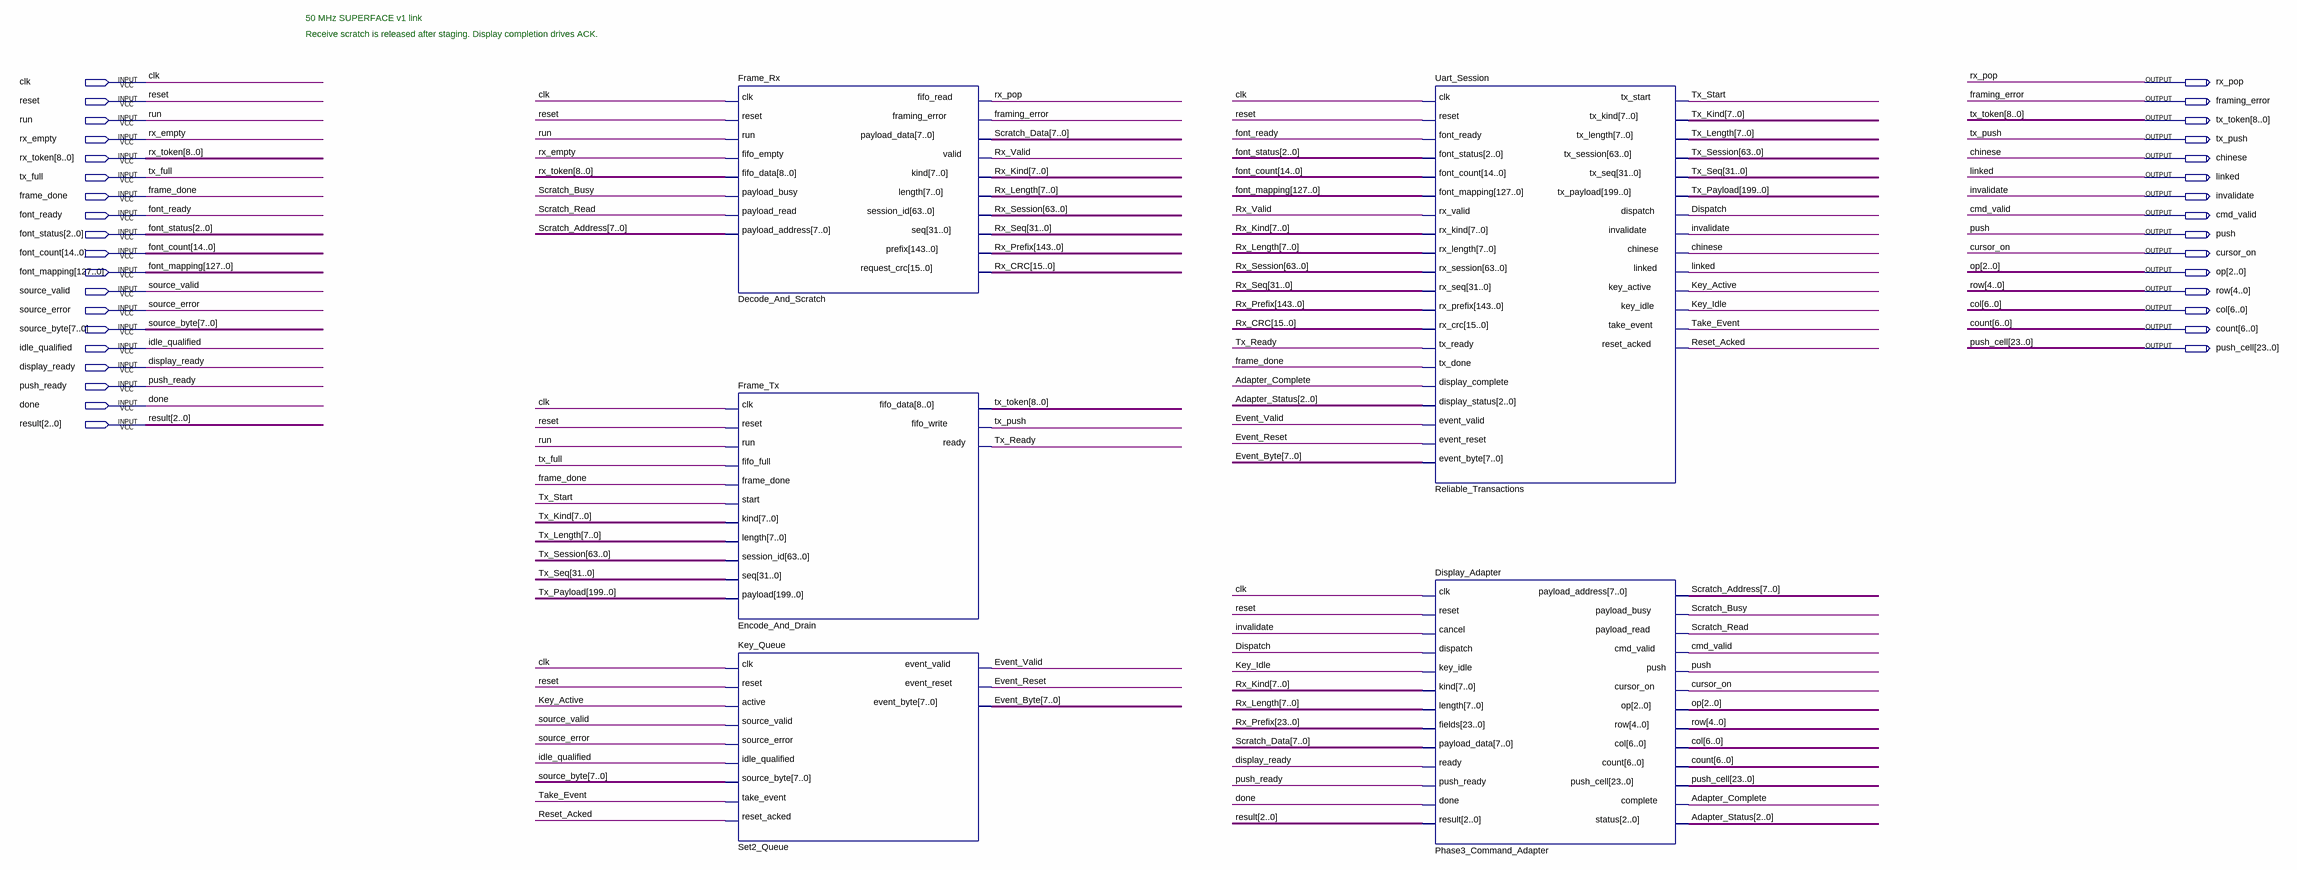
[diagram p0: schematic sheet]
// Quartus schematic UART_Link.bdf as structural Verilog: 5 symbols, 34 pins
module UART_Link (
  input  clk,
  input  reset,
  input  run,
  input  rx_empty,
  input  [8:0] rx_token,
  input  tx_full,
  input  frame_done,
  input  font_ready,
  input  [2:0] font_status,
  input  [14:0] font_count,
  input  [127:0] font_mapping,
  input  source_valid,
  input  source_error,
  input  [7:0] source_byte,
  input  idle_qualified,
  input  display_ready,
  input  push_ready,
  input  done,
  input  [2:0] result,
  output rx_pop,
  output framing_error,
  output [8:0] tx_token,
  output tx_push,
  output chinese,
  output linked,
  output invalidate,
  output cmd_valid,
  output push,
  output cursor_on,
  output [2:0] op,
  output [4:0] row,
  output [6:0] col,
  output [6:0] count,
  output [23:0] push_cell
);

  wire Adapter_Complete, Dispatch, Event_Reset, Event_Valid, Key_Active, Key_Idle, Reset_Acked, Rx_Valid,
       Scratch_Busy, Scratch_Read, Take_Event, Tx_Ready, Tx_Start;
  wire [2:0] Adapter_Status;
  wire [7:0] Event_Byte, Rx_Kind, Rx_Length, Scratch_Address, Scratch_Data, Tx_Kind, Tx_Length;
  wire [15:0] Rx_CRC;
  wire [31:0] Rx_Seq, Tx_Seq;
  wire [63:0] Rx_Session, Tx_Session;
  wire [143:0] Rx_Prefix;
  wire [199:0] Tx_Payload;

  Frame_Rx Decode_And_Scratch (
    .clk(clk), .reset(reset), .run(run), .fifo_empty(rx_empty), .fifo_data(rx_token), .fifo_read(rx_pop),
    .framing_error(framing_error), .payload_busy(Scratch_Busy), .payload_read(Scratch_Read),
    .payload_address(Scratch_Address), .payload_data(Scratch_Data), .valid(Rx_Valid), .kind(Rx_Kind),
    .length(Rx_Length), .session_id(Rx_Session), .seq(Rx_Seq), .prefix(Rx_Prefix), .request_crc(Rx_CRC));
  Frame_Tx Encode_And_Drain (
    .clk(clk), .reset(reset), .run(run), .fifo_full(tx_full), .frame_done(frame_done), .fifo_data(tx_token),
    .fifo_write(tx_push), .ready(Tx_Ready), .start(Tx_Start), .kind(Tx_Kind), .length(Tx_Length),
    .session_id(Tx_Session), .seq(Tx_Seq), .payload(Tx_Payload));
  Key_Queue Set2_Queue (
    .clk(clk), .reset(reset), .active(Key_Active), .source_valid(source_valid), .source_error(source_error),
    .idle_qualified(idle_qualified), .source_byte(source_byte), .take_event(Take_Event),
    .reset_acked(Reset_Acked), .event_valid(Event_Valid), .event_reset(Event_Reset), .event_byte(Event_Byte));
  Uart_Session Reliable_Transactions (
    .clk(clk), .reset(reset), .font_ready(font_ready), .font_status(font_status), .font_count(font_count),
    .font_mapping(font_mapping), .rx_valid(Rx_Valid), .rx_kind(Rx_Kind), .rx_length(Rx_Length),
    .rx_session(Rx_Session), .rx_seq(Rx_Seq), .rx_prefix(Rx_Prefix), .rx_crc(Rx_CRC), .tx_ready(Tx_Ready),
    .tx_done(frame_done), .tx_start(Tx_Start), .tx_kind(Tx_Kind), .tx_length(Tx_Length),
    .tx_session(Tx_Session), .tx_seq(Tx_Seq), .tx_payload(Tx_Payload), .dispatch(Dispatch),
    .invalidate(invalidate), .chinese(chinese), .linked(linked), .key_active(Key_Active),
    .key_idle(Key_Idle), .display_complete(Adapter_Complete), .display_status(Adapter_Status),
    .event_valid(Event_Valid), .event_reset(Event_Reset), .event_byte(Event_Byte), .take_event(Take_Event),
    .reset_acked(Reset_Acked));
  Display_Adapter Phase3_Command_Adapter (
    .clk(clk), .reset(reset), .cancel(invalidate), .dispatch(Dispatch), .key_idle(Key_Idle), .kind(Rx_Kind),
    .length(Rx_Length), .fields(Rx_Prefix[23:0]), .payload_data(Scratch_Data),
    .payload_address(Scratch_Address), .payload_busy(Scratch_Busy), .payload_read(Scratch_Read),
    .ready(display_ready), .push_ready(push_ready), .done(done), .result(result), .cmd_valid(cmd_valid),
    .push(push), .cursor_on(cursor_on), .op(op), .row(row), .col(col), .count(count), .push_cell(push_cell),
    .complete(Adapter_Complete), .status(Adapter_Status));

  // Notes on the sheet:
  //   50 MHz SUPERFACE v1 link
  //   Receive scratch is released after staging. Display completion drives ACK.
endmodule
